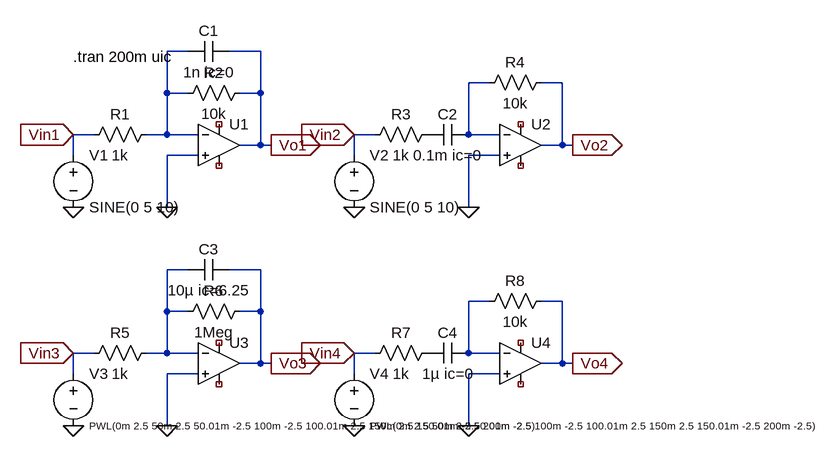
[diagram p0: schematic int-diff.asc]
int-diff.asc, the LTspice schematic file:
Version 4.1
SHEET 1 956 680
WIRE 192 16 160 16
WIRE 304 16 256 16
WIRE 656 64 624 64
WIRE 768 64 736 64
WIRE 160 80 160 16
WIRE 192 80 160 80
WIRE 304 80 304 16
WIRE 304 80 272 80
WIRE 48 144 16 144
WIRE 160 144 160 80
WIRE 160 144 128 144
WIRE 208 144 160 144
WIRE 480 144 448 144
WIRE 624 144 624 64
WIRE 672 144 624 144
WIRE 304 160 304 80
WIRE 304 160 272 160
WIRE 320 160 304 160
WIRE 768 160 768 64
WIRE 768 160 736 160
WIRE 784 160 768 160
WIRE 16 176 16 144
WIRE 208 176 160 176
WIRE 448 176 448 144
WIRE 672 176 624 176
WIRE 160 256 160 176
WIRE 624 256 624 176
WIRE 192 352 160 352
WIRE 304 352 256 352
WIRE 656 400 624 400
WIRE 768 400 736 400
WIRE 160 416 160 352
WIRE 192 416 160 416
WIRE 304 416 304 352
WIRE 304 416 272 416
WIRE 48 480 16 480
WIRE 160 480 160 416
WIRE 160 480 128 480
WIRE 208 480 160 480
WIRE 480 480 448 480
WIRE 624 480 624 400
WIRE 672 480 624 480
WIRE 304 496 304 416
WIRE 304 496 272 496
WIRE 320 496 304 496
WIRE 768 496 768 400
WIRE 768 496 736 496
WIRE 784 496 768 496
WIRE 16 512 16 480
WIRE 208 512 160 512
WIRE 448 512 448 480
WIRE 672 512 624 512
WIRE 160 592 160 512
WIRE 624 592 624 512
FLAG 16 256 0
FLAG 160 256 0
FLAG 320 160 Vo1
IOPIN 320 160 Out
FLAG 448 256 0
FLAG 624 256 0
FLAG 784 160 Vo2
IOPIN 784 160 Out
FLAG 448 144 Vin2
IOPIN 448 144 In
FLAG 16 592 0
FLAG 160 592 0
FLAG 320 496 Vo3
IOPIN 320 496 Out
FLAG 448 592 0
FLAG 624 592 0
FLAG 784 496 Vo4
IOPIN 784 496 Out
FLAG 448 480 Vin4
IOPIN 448 480 In
FLAG 16 144 Vin1
IOPIN 16 144 In
FLAG 16 480 Vin3
IOPIN 16 480 In
SYMBOL OpAmps\\UniversalOpAmp 240 160 R0
SYMATTR InstName U1
SYMBOL res 144 128 R90
WINDOW 0 0 56 VBottom 2
WINDOW 3 32 56 VTop 2
SYMATTR InstName R1
SYMATTR Value 1k
SYMBOL res 288 64 R90
WINDOW 0 0 56 VBottom 2
WINDOW 3 32 56 VTop 2
SYMATTR InstName R2
SYMATTR Value 10k
SYMBOL cap 256 0 R90
WINDOW 0 0 32 VBottom 2
WINDOW 3 32 32 VTop 2
SYMATTR InstName C1
SYMATTR Value 1n ic=0
SYMBOL voltage 16 160 R0
WINDOW 123 0 0 Left 0
WINDOW 39 0 0 Left 0
SYMATTR InstName V1
SYMATTR Value SINE(0 5 10)
SYMBOL OpAmps\\UniversalOpAmp 704 160 R0
SYMATTR InstName U2
SYMBOL res 576 128 R90
WINDOW 0 0 56 VBottom 2
WINDOW 3 32 56 VTop 2
SYMATTR InstName R3
SYMATTR Value 1k
SYMBOL res 752 48 R90
WINDOW 0 0 56 VBottom 2
WINDOW 3 32 56 VTop 2
SYMATTR InstName R4
SYMATTR Value 10k
SYMBOL cap 624 128 R90
WINDOW 0 0 32 VBottom 2
WINDOW 3 32 32 VTop 2
SYMATTR InstName C2
SYMATTR Value 0.1m ic=0
SYMBOL voltage 448 160 R0
WINDOW 123 0 0 Left 0
WINDOW 39 0 0 Left 0
SYMATTR InstName V2
SYMATTR Value SINE(0 5 10)
SYMBOL OpAmps\\UniversalOpAmp 240 496 R0
SYMATTR InstName U3
SYMBOL res 144 464 R90
WINDOW 0 0 56 VBottom 2
WINDOW 3 32 56 VTop 2
SYMATTR InstName R5
SYMATTR Value 1k
SYMBOL res 288 400 R90
WINDOW 0 0 56 VBottom 2
WINDOW 3 32 56 VTop 2
SYMATTR InstName R6
SYMATTR Value 1Meg
SYMBOL cap 256 336 R90
WINDOW 0 0 32 VBottom 2
WINDOW 3 32 32 VTop 2
SYMATTR InstName C3
SYMATTR Value 10µ ic=6.25
SYMBOL voltage 16 496 R0
WINDOW 3 24 96 Left 1
WINDOW 123 0 0 Left 0
WINDOW 39 0 0 Left 0
SYMATTR InstName V3
SYMATTR Value PWL(0m 2.5 50m 2.5 50.01m -2.5 100m -2.5 100.01m 2.5 150m 2.5 150.01m -2.5 200m -2.5)
SYMBOL OpAmps\\UniversalOpAmp 704 496 R0
SYMATTR InstName U4
SYMBOL res 576 464 R90
WINDOW 0 0 56 VBottom 2
WINDOW 3 32 56 VTop 2
SYMATTR InstName R7
SYMATTR Value 1k
SYMBOL res 752 384 R90
WINDOW 0 0 56 VBottom 2
WINDOW 3 32 56 VTop 2
SYMATTR InstName R8
SYMATTR Value 10k
SYMBOL cap 624 464 R90
WINDOW 0 0 32 VBottom 2
WINDOW 3 32 32 VTop 2
SYMATTR InstName C4
SYMATTR Value 1µ ic=0
SYMBOL voltage 448 496 R0
WINDOW 3 24 96 Left 1
WINDOW 123 0 0 Left 0
WINDOW 39 0 0 Left 0
SYMATTR InstName V4
SYMATTR Value PWL(0m 2.5 50m 2.5 50.01m -2.5 100m -2.5 100.01m 2.5 150m 2.5 150.01m -2.5 200m -2.5)
TEXT 16 24 Left 2 !.tran 200m uic

The netlist it stands for:
* int-diff.asc
X§U1 0 N001 NC_01 NC_02 Vo1 level1 Avol=1Meg GBW=10Meg Vos=0 En=0 Enk=0 In=0 Ink=0 Rin=500Meg  ; pins In+ In- V+ V- OUT
R1 N001 Vin1 1k
R2 Vo1 N001 10k
C1 Vo1 N001 1n ic=0
V1 Vin1 0 SINE(0 5 10)
X§U2 0 N002 NC_03 NC_04 Vo2 level1 Avol=1Meg GBW=10Meg Vos=0 En=0 Enk=0 In=0 Ink=0 Rin=500Meg  ; pins In+ In- V+ V- OUT
R3 P001 Vin2 1k
R4 Vo2 N002 10k
C2 N002 P001 0.1m ic=0
V2 Vin2 0 SINE(0 5 10)
X§U3 0 N003 NC_05 NC_06 Vo3 level1 Avol=1Meg GBW=10Meg Vos=0 En=0 Enk=0 In=0 Ink=0 Rin=500Meg  ; pins In+ In- V+ V- OUT
R5 N003 Vin3 1k
R6 Vo3 N003 1Meg
C3 Vo3 N003 10µ ic=6.25
V3 Vin3 0 PWL(0m 2.5 50m 2.5 50.01m -2.5 100m -2.5 100.01m 2.5 150m 2.5 150.01m -2.5 200m -2.5)
X§U4 0 N004 NC_07 NC_08 Vo4 level1 Avol=1Meg GBW=10Meg Vos=0 En=0 Enk=0 In=0 Ink=0 Rin=500Meg  ; pins In+ In- V+ V- OUT
R7 P002 Vin4 1k
R8 Vo4 N004 10k
C4 N004 P002 1µ ic=0
V4 Vin4 0 PWL(0m 2.5 50m 2.5 50.01m -2.5 100m -2.5 100.01m 2.5 150m 2.5 150.01m -2.5 200m -2.5)
.tran 200m uic
.lib UniversalOpAmp1.lib
.backanno
.end